# Altium schematic sheet 04.Input_Output.SchDoc: 04.Input_Output
size A4; Organization: Altium Limited; Address1: L3, 12a Rodborough Rd; Address2: Frenchs Forest; Address3: NSW; Address4: Australia 2086; Revision: V1; SheetNumber: 5; SheetTotal: 6; Project: CH32V307VCT6
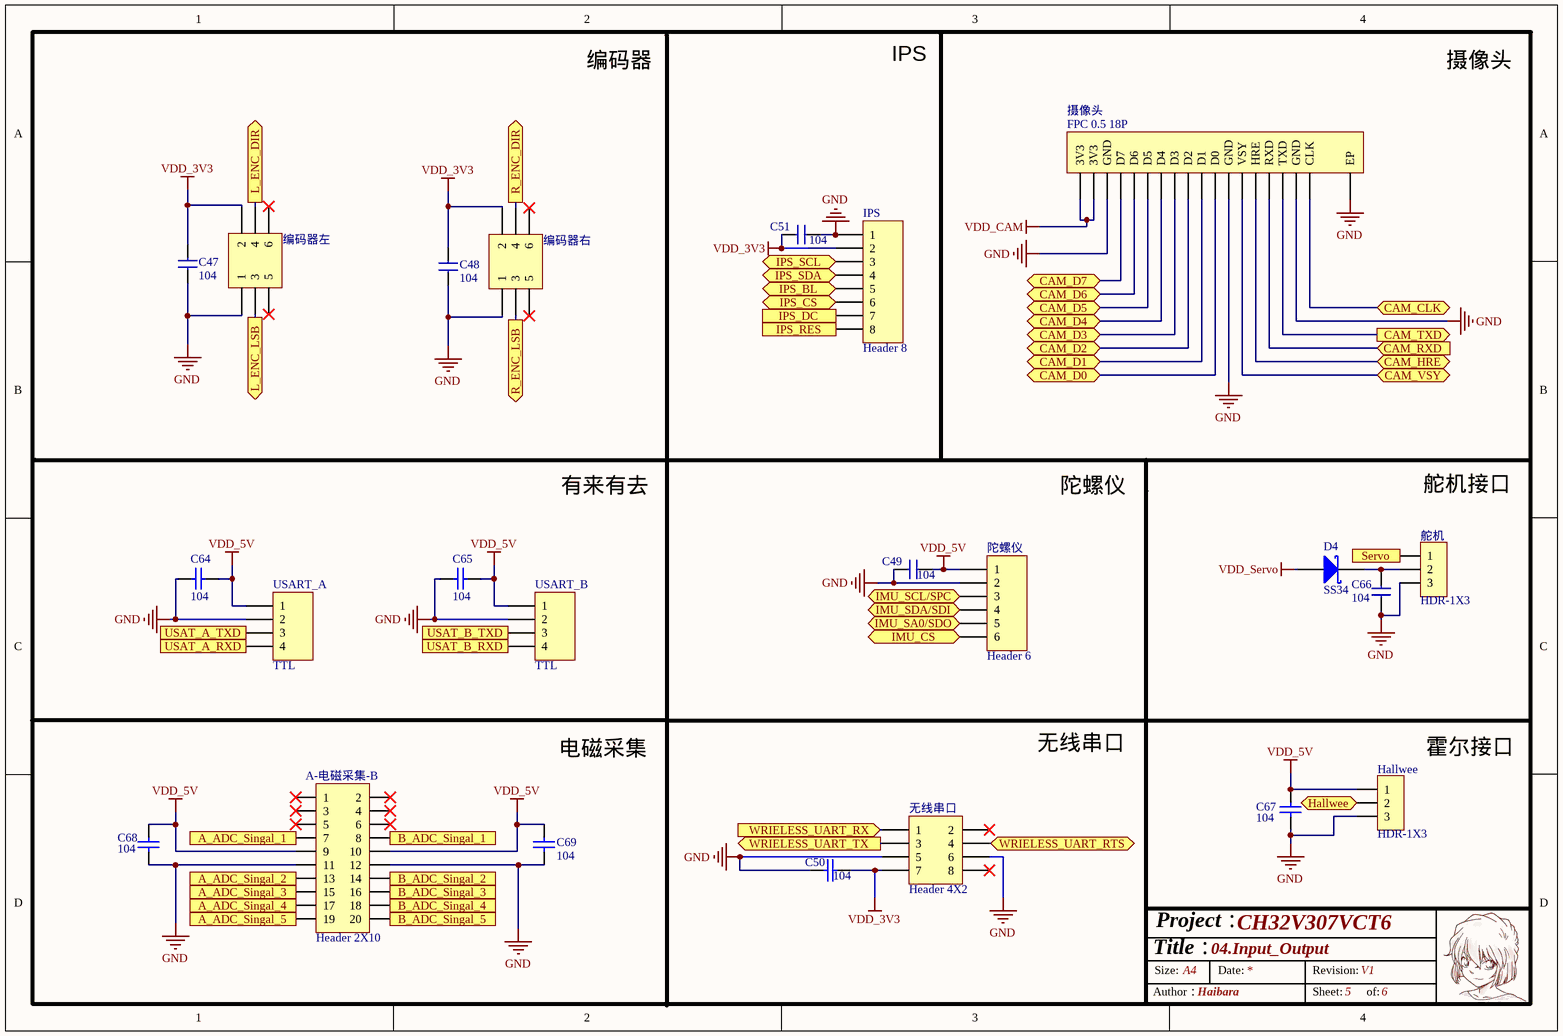
[diagram p0: 04.Input_Output.SchDoc]

## Parts
A-电磁采集-B  Header 2X10  [HDR2.54-LI-2x10P]
C47  104  [C0603]
C48  104  [C0603]
C49  104  [C0603]
C50  104  [0603 电容 C3]
C51  104  [C0603]
C64  104  [0603 电容 C3]
C65  104  [0603 电容 C3]
C66  104  [C0603]
C67  104  [0603 电容 C3]
C68  104  [0603 电容 C3]
C69  104  [0603 电容 C3]
D4  SS34  [SMA]
Hallwee  HDR-1X3  [HDR2.54-M-LI-3P]
IPS  Header 8  [HDR2.54-M-LI-8P]
USART_A  TTL  [HDR2.54-M-LI-4P]
USART_B  TTL  [HDR2.54-M-LI-4P]
摄像头  FPC 0.5 18P  [FPC0.5 2H-WS-18P]
无线串口  Header 4X2  [2.54mm 4P*2排母]
编码器右  Header 3X2  [DC-2.54-L-Z-6P]  (value not drawn)
编码器左  Header 3X2  [DC-2.54-L-Z-6P]  (value not drawn)
舵机  HDR-1X3  [HDR2.54-M-LI-3P]
陀螺仪  Header 6  [MX 1.25-WS-6P]

## Ports
A_ADC_Singal_1 (out), A_ADC_Singal_2 (out), A_ADC_Singal_3 (out), A_ADC_Singal_4 (out), A_ADC_Singal_5 (out), B_ADC_Singal_1 (out), B_ADC_Singal_2 (out), B_ADC_Singal_3 (out), B_ADC_Singal_4 (out), B_ADC_Singal_5 (out), CAM_CLK (bidir), CAM_D0 (bidir), CAM_D1 (bidir), CAM_D2 (bidir), CAM_D3 (bidir), CAM_D4 (bidir), CAM_D5 (bidir), CAM_D6 (bidir), CAM_D7 (bidir), CAM_HRE (bidir), CAM_RXD (in), CAM_TXD (out), CAM_VSY (bidir), Hallwee (bidir), IMU_CS (bidir), IMU_SA0/SDO (bidir), IMU_SCL/SPC (bidir), IMU_SDA/SDI (bidir), IPS_BL (bidir), IPS_CS (bidir), IPS_DC (in), IPS_RES (in), IPS_SCL (bidir), IPS_SDA (bidir), L_ENC_DIR (out), L_ENC_LSB (out), R_ENC_DIR (out), R_ENC_LSB (out), Servo (in), USAT_A_RXD (in), USAT_A_TXD (out), USAT_B_RXD (in), USAT_B_TXD (out), WRIELESS_UART_RTS (bidir), WRIELESS_UART_RX (in), WRIELESS_UART_TX (out)

## Nets
GND: A-电磁采集-B.11 A-电磁采集-B.12 C47.1 C48.1 C49.2 C50.2 C51.2 C64.2 C65.2 C66.1 C67.1 C68.1 C69.1 Hallwee.3 IPS.1 USART_A.2 USART_B.2 摄像头.0(EP) 摄像头.3(GND) 摄像头.12(GND) 摄像头.17(GND) 无线串口.5 无线串口.6 编码器右.1 编码器左.1 舵机.3 陀螺仪.2
VDD_3V3: C47.2 C48.2 C50.1 C51.1 IPS.2 无线串口.7 编码器右.2 编码器左.2
VDD_5V: A-电磁采集-B.9 A-电磁采集-B.10 C49.1 C64.1 C65.1 C67.2 C68.2 C69.2 Hallwee.1 USART_A.1 USART_B.1 陀螺仪.1
VDD_CAM: 摄像头.1(3V3) 摄像头.2(3V3)
VDD_Servo: D4.1(A)
A_ADC_Singal_1: A-电磁采集-B.7 ; port A_ADC_Singal_1
A_ADC_Singal_2: A-电磁采集-B.13 ; port A_ADC_Singal_2
A_ADC_Singal_3: A-电磁采集-B.15 ; port A_ADC_Singal_3
A_ADC_Singal_4: A-电磁采集-B.17 ; port A_ADC_Singal_4
A_ADC_Singal_5: A-电磁采集-B.19 ; port A_ADC_Singal_5
B_ADC_Singal_1: A-电磁采集-B.8 ; port B_ADC_Singal_1
B_ADC_Singal_2: A-电磁采集-B.14 ; port B_ADC_Singal_2
B_ADC_Singal_3: A-电磁采集-B.16 ; port B_ADC_Singal_3
B_ADC_Singal_4: A-电磁采集-B.18 ; port B_ADC_Singal_4
B_ADC_Singal_5: A-电磁采集-B.20 ; port B_ADC_Singal_5
CAM_CLK: 摄像头.18(CLK) ; port CAM_CLK
CAM_D0: 摄像头.11(D0) ; port CAM_D0
CAM_D1: 摄像头.10(D1) ; port CAM_D1
CAM_D2: 摄像头.9(D2) ; port CAM_D2
CAM_D3: 摄像头.8(D3) ; port CAM_D3
CAM_D4: 摄像头.7(D4) ; port CAM_D4
CAM_D5: 摄像头.6(D5) ; port CAM_D5
CAM_D6: 摄像头.5(D6) ; port CAM_D6
CAM_D7: 摄像头.4(D7) ; port CAM_D7
CAM_HRE: 摄像头.14(HRE) ; port CAM_HRE
CAM_RXD: 摄像头.15(RXD) ; port CAM_RXD
CAM_TXD: 摄像头.16(TXD) ; port CAM_TXD
CAM_VSY: 摄像头.13(VSY) ; port CAM_VSY
Hallwee: Hallwee.2 ; port Hallwee
IMU_CS: 陀螺仪.6 ; port IMU_CS
IMU_SA0/SDO: 陀螺仪.5 ; port IMU_SA0/SDO
IMU_SCL/SPC: 陀螺仪.3 ; port IMU_SCL/SPC
IMU_SDA/SDI: 陀螺仪.4 ; port IMU_SDA/SDI
IPS_BL: IPS.5 ; port IPS_BL
IPS_CS: IPS.6 ; port IPS_CS
IPS_DC: IPS.7 ; port IPS_DC
IPS_RES: IPS.8 ; port IPS_RES
IPS_SCL: IPS.3 ; port IPS_SCL
IPS_SDA: IPS.4 ; port IPS_SDA
L_ENC_DIR: 编码器左.4 ; port L_ENC_DIR
L_ENC_LSB: 编码器左.3 ; port L_ENC_LSB
R_ENC_DIR: 编码器右.4 ; port R_ENC_DIR
R_ENC_LSB: 编码器右.3 ; port R_ENC_LSB
Servo: 舵机.1 ; port Servo
USAT_A_RXD: USART_A.4 ; port USAT_A_RXD
USAT_A_TXD: USART_A.3 ; port USAT_A_TXD
USAT_B_RXD: USART_B.4 ; port USAT_B_RXD
USAT_B_TXD: USART_B.3 ; port USAT_B_TXD
WRIELESS_UART_RTS: 无线串口.4 ; port WRIELESS_UART_RTS
WRIELESS_UART_RX: 无线串口.1 ; port WRIELESS_UART_RX
WRIELESS_UART_TX: 无线串口.3 ; port WRIELESS_UART_TX
NetC66_2: C66.2 D4.2(K) 舵机.2

Not connected (* = marked no-connect by the designer): A-电磁采集-B 1* 2* 3* 4* 5* 6*; 无线串口 2* 8*; 编码器右 5* 6*; 编码器左 5* 6*

## Notes on the sheet
- Labels drawn without touching a wire or pin: IPS, 摄像头, 无线串口, 有来有去, 电磁采集, 编码器, 舵机接口, 陀螺仪, 霍尔接口
- Title：
- Size:
- Project：
- A4
- Date:
- Revision:
- Author：
- Haibara
- Sheet:
- of:

## Library data of the parts
A-电磁采集-B = Header 10X2: 10*2P接插件; 版权归属: 源创客; BOM名称: 10*2P接插件; 学习资源: www.ooocke.com
C47-C49 C51 C66 = 电容
C50 C64 C65 C67-C69 = Cap: Capacitor; Published: 8-Jun-2000; LatestRevisionDate: 17-Jul-2002; LatestRevisionNote: Re-released for DXP Platform.; PackageReference: RAD-0.3; Publisher: Altium Limited; PackageDescription: Radial Cap, Thru-Hole; 2 Leads; 0.3 in Pin Spacing
D4 = 肖特基二极管: Schottky Rectifier; Note: Terminal 2 is the TAB and is electrically connected to the cathode; Published: 8-Jun-2000; LatestRevisionDate: 17-Jul-2002; LatestRevisionNote: Re-released for DXP Platform.; DatasheetVersion: PD-2.057B; PackageVersion: Feb-1998; PackageReference: TO-220AC; Publisher: Altium Limited; PackageDescription: TO, Thru-Hole, Vertical, Heatsink Mounted; 3 In-Line Leads (1 Absent); Pitch 2.54 mm; ComponentLink1Description: Manufacturer Link; ComponentLink1URL: http://www.irf.com/; ComponentLink2Description: Datasheet; ComponentLink2URL: http://www.irf.com/product-info/datasheets/data/10tq.pdf
Hallwee 舵机 = Header 3: 3P接插件; 版权归属: 封装库来自淘宝 ID：黄晶宝石; BOM名称: 3P接插件; 学习资源: https://shop463601444.taobao.com
IPS = Header 8: Header, 8-Pin; LatestRevisionDate: 17-Jul-2002; LatestRevisionNote: Re-released for DXP Platform.; Publisher: Altium Limited
USART_A USART_B = Header 4: Header, 4-Pin; LatestRevisionDate: 17-Jul-2002; LatestRevisionNote: Re-released for DXP Platform.; Publisher: Altium Limited
摄像头 = 18P Cam: Header, 25-Pin; LatestRevisionDate: 17-Jul-2002; LatestRevisionNote: Re-released for DXP Platform.; Publisher: Altium Limited
无线串口 = Header 4X2: Header, 4-Pin, Dual row; LatestRevisionDate: 17-Jul-2002; LatestRevisionNote: Re-released for DXP Platform.; Publisher: Altium Limited
编码器右 编码器左 = Header 3X2: Header, 3-Pin, Dual row; LatestRevisionDate: 17-Jul-2002; LatestRevisionNote: Re-released for DXP Platform.; Publisher: Altium Limited
陀螺仪 = Header 6: Header, 6-Pin; LatestRevisionDate: 17-Jul-2002; LatestRevisionNote: Re-released for DXP Platform.; Publisher: Altium Limited